# Altium schematic sheet Sheet7_Mechanical.SchDoc
size A4; SheetNumber: 7; SheetTotal: 7
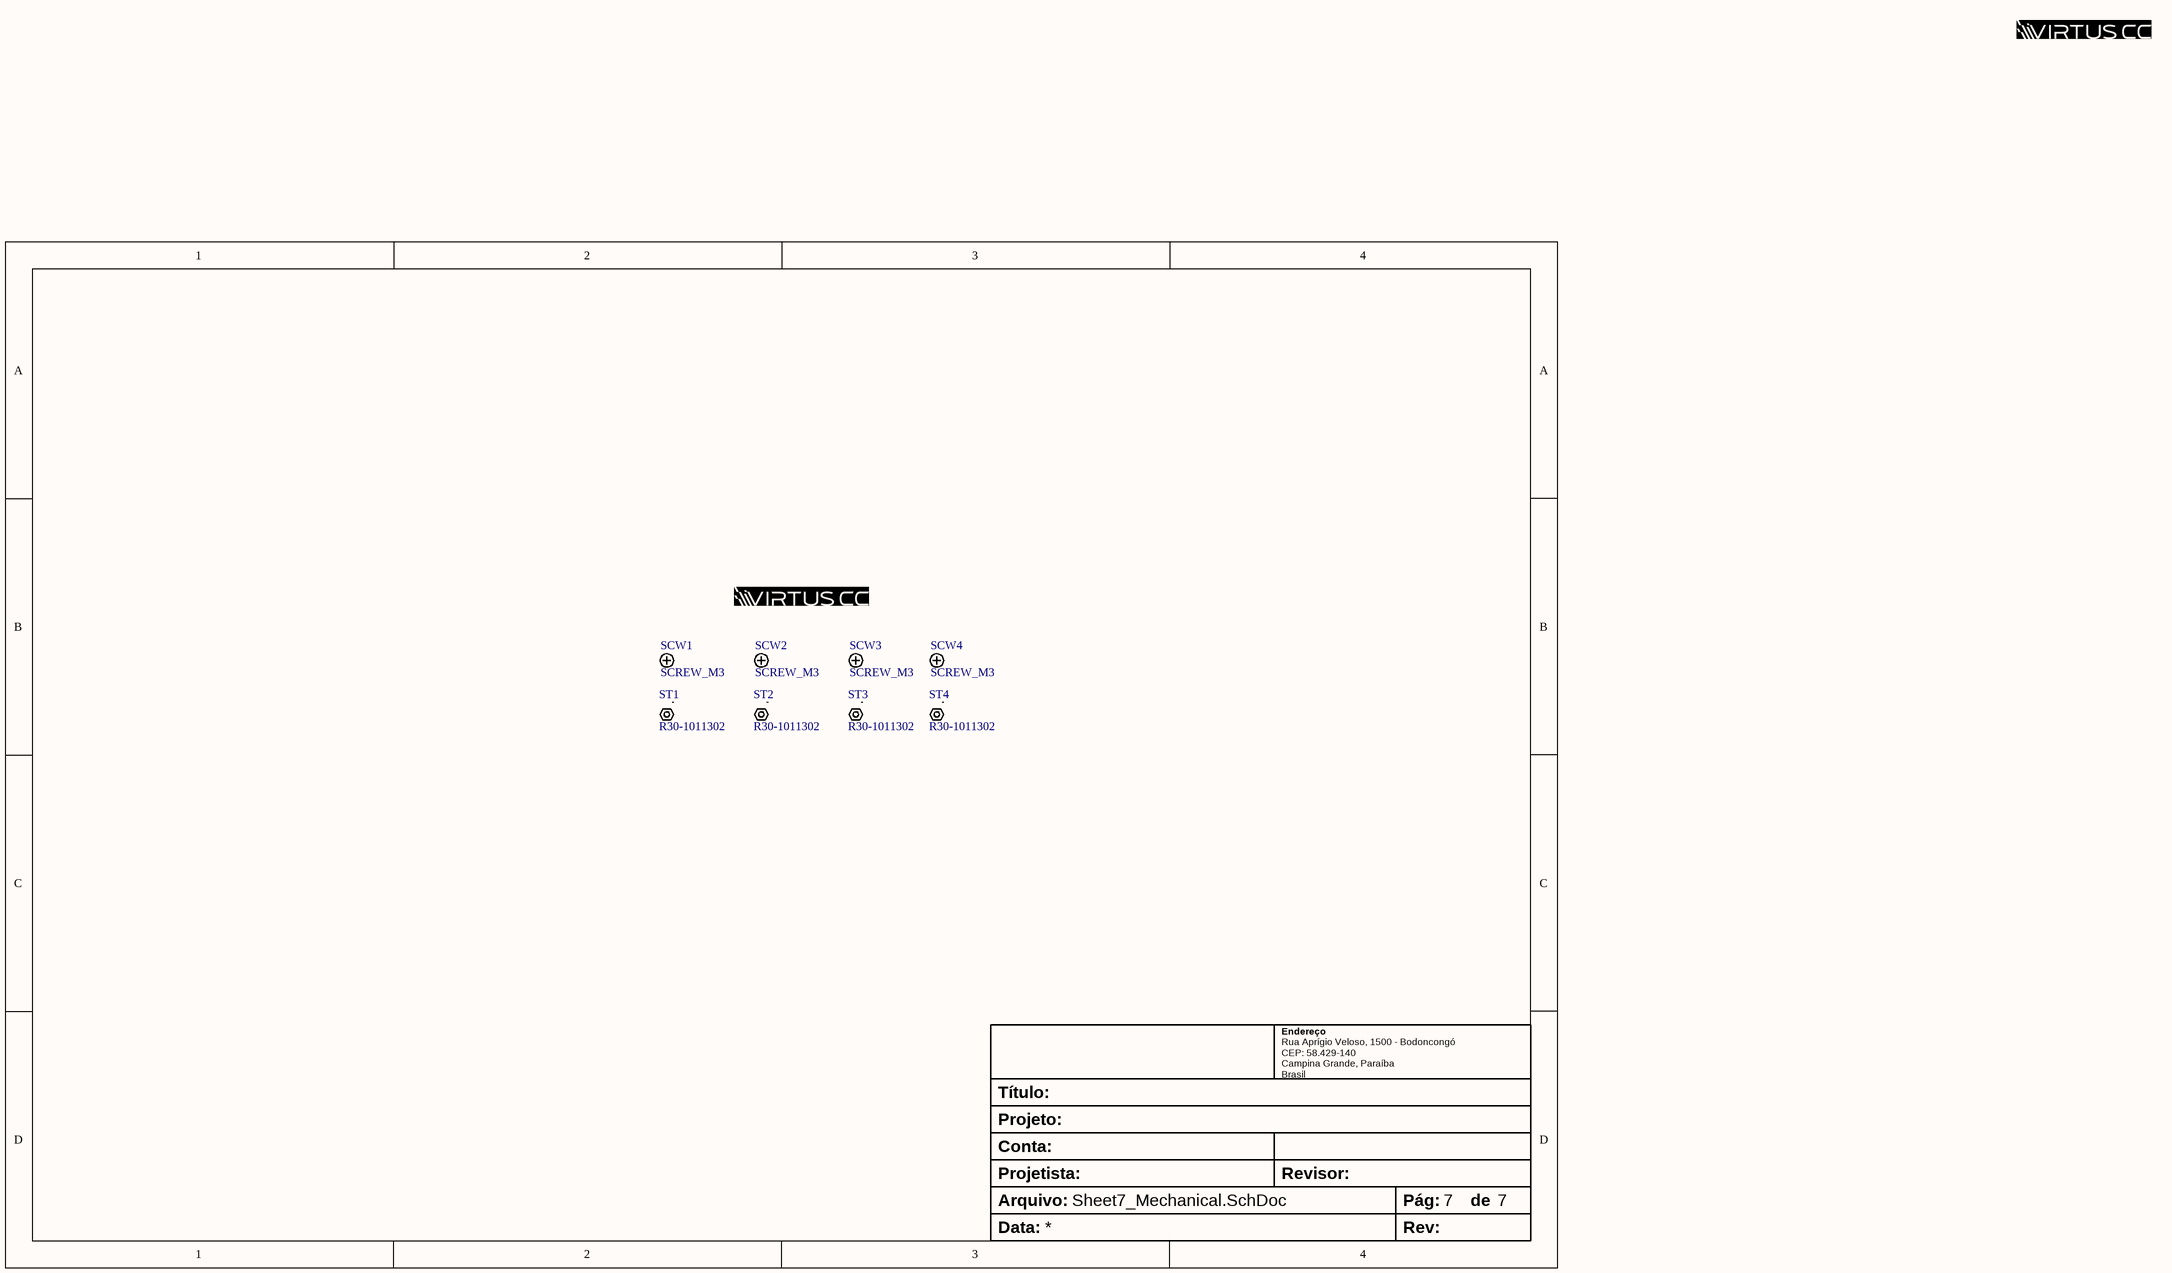
[diagram p0: Sheet7_Mechanical.SchDoc]

## Parts
?  (no value)  (graphical)
LG1  Logo Virtus  [Logo Virtus CC]  (value not drawn)
LG2  Logo Virtus  [Logo Virtus CC]  (value not drawn)
SCW1  SCREW_M3  [screwM3]
SCW2  SCREW_M3  [screwM3]
SCW3  SCREW_M3  [screwM3]
SCW4  SCREW_M3  [screwM3]
ST1  R30-1011302  [R30-1011302]
ST2  R30-1011302  [R30-1011302]
ST3  R30-1011302  [R30-1011302]
ST4  R30-1011302  [R30-1011302]

## Notes on the sheet
- Endereço
- Título:
- Rua Aprígio Veloso, 1500 - Bodoncongó
  CEP: 58.429-140
  Campina Grande, Paraíba
  Brasil
- Projeto:
- Conta:
- Projetista:
- Arquivo:
- Data:
- Revisor:
- Pág:
- Rev:
- de

## Library data of the parts
? = Title Block
ST1-ST4 = R30-1011302: HEX STANDOFF M3X0.5 BRASS 13MM